# EasyEDA Pro project ProPrj_CraftVia-Core-S-RP235xA-v1-Rev0_2026-11-04.epro, schematic RPI-RP2350A-MINIMAL_R4-S1
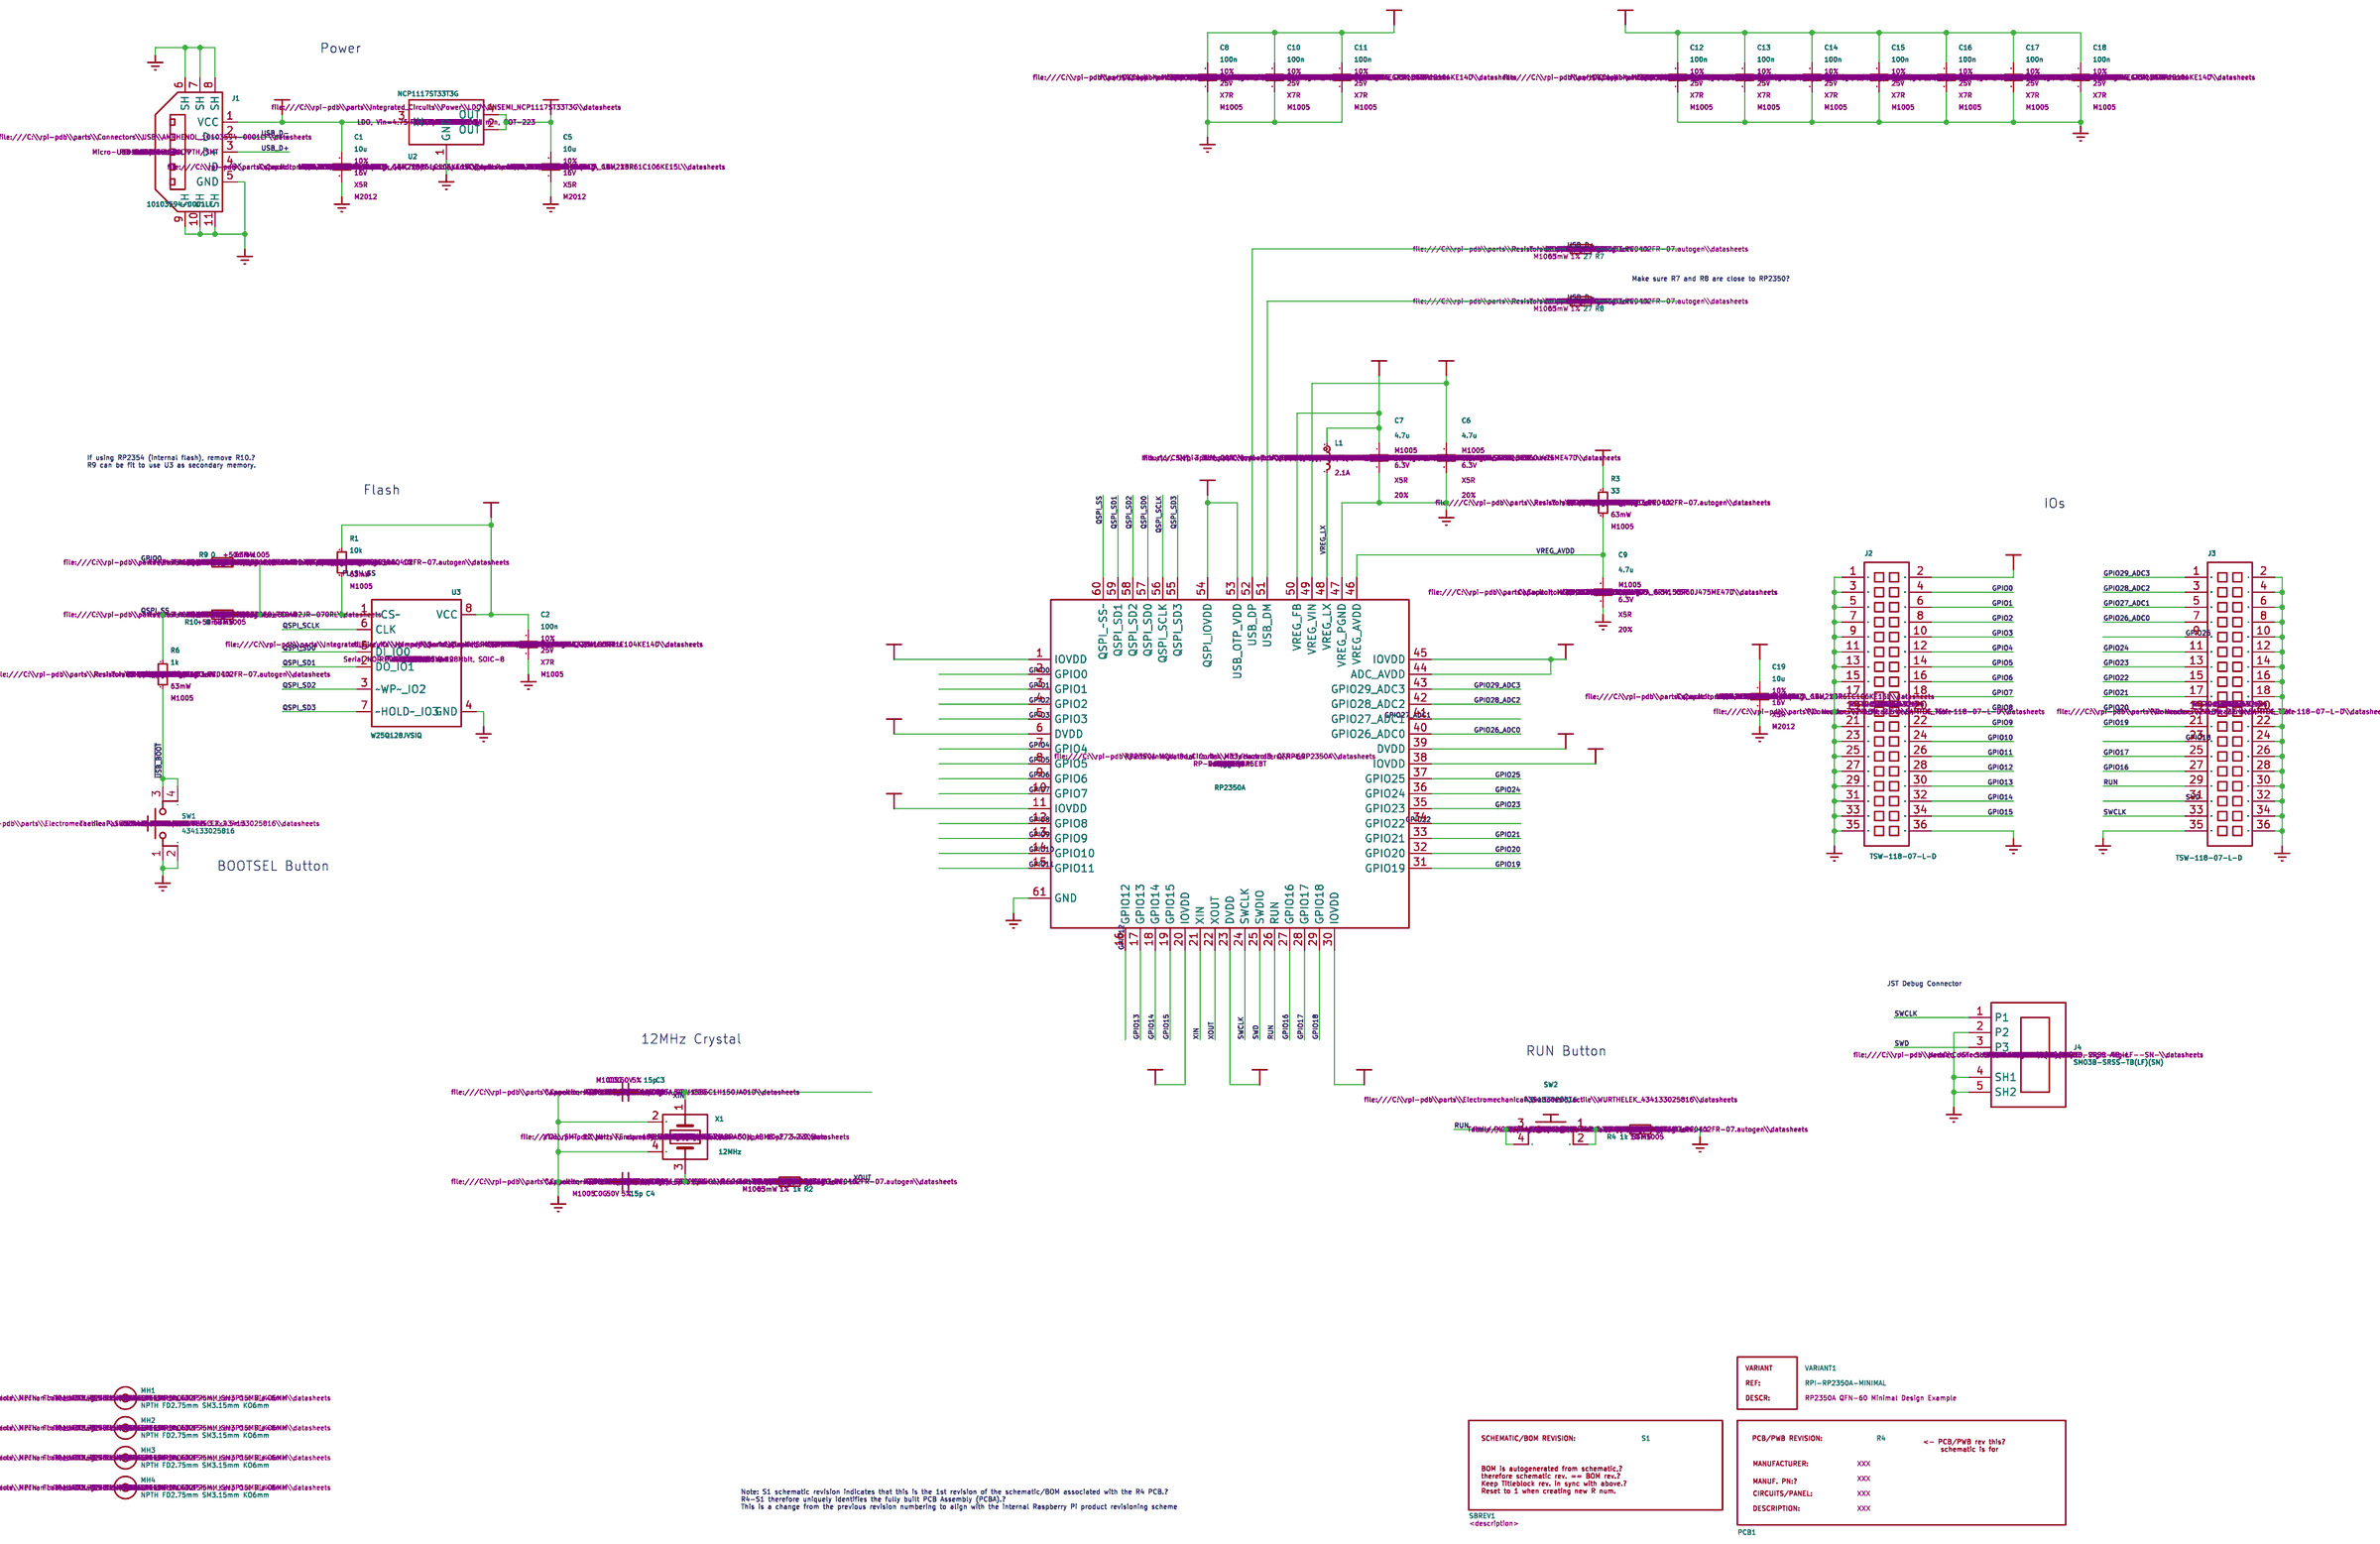
[diagram p0: schematic sheet]

## Parts
C1  10u  [RPI_COMPILED:generic_capc2012x125]
C2  100n  [RPI_COMPILED:generic_capc1005x50]
C3  15p  [RPI_COMPILED:generic_capc1005x50]
C4  15p  [RPI_COMPILED:generic_capc1005x50]
C5  10u  [RPI_COMPILED:generic_capc2012x125]
C6  4.7u  [RPI_COMPILED:generic_capc1005x50_wide]
C7  4.7u  [RPI_COMPILED:generic_capc1005x50_wide]
C8  100n  [RPI_COMPILED:generic_capc1005x50]
C9  4.7u  [RPI_COMPILED:generic_capc1005x50]
C10  100n  [RPI_COMPILED:generic_capc1005x50]
C11  100n  [RPI_COMPILED:generic_capc1005x50]
C12  100n  [RPI_COMPILED:generic_capc1005x50]
C13  100n  [RPI_COMPILED:generic_capc1005x50]
C14  100n  [RPI_COMPILED:generic_capc1005x50]
C15  100n  [RPI_COMPILED:generic_capc1005x50]
C16  100n  [RPI_COMPILED:generic_capc1005x50]
C17  100n  [RPI_COMPILED:generic_capc1005x50]
C18  100n  [RPI_COMPILED:generic_capc1005x50]
C19  10u  [RPI_COMPILED:generic_capc2012x125]
J1  10103594-0001LF  [RPI_COMPILED:amphenol_10103594-0001lf]
J2  TSW-118-07-L-D  [RPI_COMPILED:samtec_tsw-118-07-l-d]
J3  TSW-118-07-L-D  [RPI_COMPILED:samtec_tsw-118-07-l-d]
J4  SM03B-SRSS-TB(LF)(SN)  [RPI_COMPILED:jst_sm03b-srss-tb-lf--sn-]
L1  3.3u  [RPI_COMPILED:abracon_aota-b201610s3r3-101-t]
MH1  NPTH FD2.75mm SM3.15mm KO6mm  [RPI_COMPILED:none_mh_npth_fd2p75mm_sm3p15mm_ko6mm]
MH2  NPTH FD2.75mm SM3.15mm KO6mm  [RPI_COMPILED:none_mh_npth_fd2p75mm_sm3p15mm_ko6mm]
MH3  NPTH FD2.75mm SM3.15mm KO6mm  [RPI_COMPILED:none_mh_npth_fd2p75mm_sm3p15mm_ko6mm]
MH4  NPTH FD2.75mm SM3.15mm KO6mm  [RPI_COMPILED:none_mh_npth_fd2p75mm_sm3p15mm_ko6mm]
PCB1  R4
R1  10k  [RPI_COMPILED:generic_resc1005x35]
R2  1k  [RPI_COMPILED:generic_resc1005x35]
R3  33  [RPI_COMPILED:generic_resc1005x35]
R4  1k  [RPI_COMPILED:generic_resc1005x35]
R6  1k  [RPI_COMPILED:generic_resc1005x35]
R7  27  [RPI_COMPILED:generic_resc1005x35]
R8  27  [RPI_COMPILED:generic_resc1005x35]
R9  0  [RPI_COMPILED:generic_resc1005x35]
R10  0  [RPI_COMPILED:generic_resc1005x35]
SBREV1  S1
SW1  434133025816  [RPI_COMPILED:wurthelek_434133025816]
SW2  434133025816  [RPI_COMPILED:wurthelek_434133025816]
U1  RP2350A  [RPI_COMPILED:rpi_rp2350a_vias]
U2  NCP1117ST33T3G  [RPI_COMPILED:onsemi_ncp1117st33t3g]
U3  W25Q128JVSIQ  [RPI_COMPILED:generic_soic127p790x195-8]
VARIANT1  RPI-RP2350A-MINIMAL
X1  12MHz  [RPI_COMPILED:generic_xtalcc320x250x80-4]

## Library data of the parts
C1 C5 C19 = RPI_DB_Capacitors | MLCC | M2012/RP-01GYSK-AVBE41: Capacitor, MLCC, 10uF, 10%, M2012, 16V, X5R; UserDocLink: file:///C:\\rpi-pdb\\parts\\Capacitors\\MLCC\\M2012\\MURATA_GRM21BR61C106KE15L\\datasheets; package: M2012; voltage: 16V; dielectric: X5R; tolerance: 10%; part_uid: RP-01GYSK-AVBE41; manufacturer: Murata; manufacturer_pn: GRM21BR61C106KE15L; packaging: 180mm embossed taping; packaging_qty: 3000; temp_coefficient: X5R; operating_temp_max: +85C; operating_temp_min: -55C; material: Ceramic; size: 2.0x1.25x1.25mm; z_height_nom: 1.25mm; Datasheet: file:///C:\\rpi-pdb\\parts\\Capacitors\\MLCC\\M2012\\MURATA_GRM21BR61C106KE15L\\datasheets; status: OK; lcsc_pn: C77075
C2 C8 C10-C18 = RPI_DB_Capacitors | MLCC | M1005/RP-01BJ9Y-KRGF41: Capacitor, MLCC, 100nF, 10%, M1005, 25V, X7R; UserDocLink: file:///C:\\rpi-pdb\\parts\\Capacitors\\MLCC\\M1005\\MURATA_GRM155R71E104KE14D\\datasheets; package: M1005; voltage: 25V; dielectric: X7R; tolerance: 10%; part_uid: RP-01BJ9Y-KRGF41; manufacturer: Murata; manufacturer_pn: GRM155R71E104KE14D; packaging: 180mm paper taping; packaging_qty: 10000; temp_coefficient: X7R; operating_temp_max: +125C; operating_temp_min: -55C; material: Ceramic; size: 1.0x0.5x0.5mm; z_height_nom: 0.5mm; Datasheet: file:///C:\\rpi-pdb\\parts\\Capacitors\\MLCC\\M1005\\MURATA_GRM155R71E104KE14D\\datasheets; status: OK; lcsc_pn: C77014
C3 C4 = RPI_DB_Capacitors | MLCC | M1005/RP-01C89W-LLY9XV: Capacitor, MLCC, 15pF, 5%, M1005, 50V, C0G; UserDocLink: file:///C:\\rpi-pdb\\parts\\Capacitors\\MLCC\\M1005\\MURATA_GRM1555C1H150JA01D\\datasheets; package: M1005; voltage: 50V; dielectric: C0G; tolerance: 5%; part_uid: RP-01C89W-LLY9XV; manufacturer: Murata; manufacturer_pn: GRM1555C1H150JA01D; packaging: 180mm paper taping; packaging_qty: 10000; temp_coefficient: C0G; operating_temp_max: +125C; operating_temp_min: -55C; material: Ceramic; size: 1.0x0.5x0.5mm; z_height_nom: 0.5mm; Datasheet: file:///C:\\rpi-pdb\\parts\\Capacitors\\MLCC\\M1005\\MURATA_GRM1555C1H150JA01D\\datasheets; status: OK; lcsc_pn: C76950
C6 C7 C9 = RPI_DB_Capacitors | MLCC | M1005/RP-019A1P-0C2GHY: Capacitor, MLCC, 4.7uF, 20%, M1005, 6.3V, X5R; UserDocLink: file:///C:\\rpi-pdb\\parts\\Capacitors\\MLCC\\M1005\\MURATA_GRM155R60J475ME47D\\datasheets; package: M1005; voltage: 6.3V; dielectric: X5R; tolerance: 20%; part_uid: RP-019A1P-0C2GHY; manufacturer: Murata; manufacturer_pn: GRM155R60J475ME47D; packaging: 180mm paper taping; packaging_qty: 10000; temp_coefficient: X5R; operating_temp_max: +85C; operating_temp_min: -55C; material: Ceramic; size: 1.0x0.5x0.5mm; z_height_nom: 0.5mm; Datasheet: file:///C:\\rpi-pdb\\parts\\Capacitors\\MLCC\\M1005\\MURATA_GRM155R60J475ME47D\\datasheets; status: OK; lcsc_pn: C82453
J1 = RPI_DB_Connectors | USB/RP-019A1P-1JAX7V: Micro-USB B, Socket, RA, PTH/SMT; UserDocLink: file:///C:\\rpi-pdb\\parts\\Connectors\\USB\\AMPHENOL_10103594-0001LF\\datasheets; part_uid: RP-019A1P-1JAX7V; manufacturer: Amphenol; size: 8x6x2.85mm; z_height_nom: 2.85mm; Datasheet: file:///C:\\rpi-pdb\\parts\\Connectors\\USB\\AMPHENOL_10103594-0001LF\\datasheets; status: OK; lcsc_pn: C428495
J2 J3 = RPI_DB_Connectors | Pin_Headers/RP-01JWH2-G371Y4: Pin Header, 02x18W, 2.54mm, PTH, Male; UserDocLink: file:///C:\\rpi-pdb\\parts\\Connectors\\Pin_Headers\\SAMTEC_TSW-118-07-L-D\\datasheets; part_uid: RP-01JWH2-G371Y4; manufacturer: Samtec; size: 45.72x5.08x10.92mm; z_height_nom: 10.92mm; Datasheet: file:///C:\\rpi-pdb\\parts\\Connectors\\Pin_Headers\\SAMTEC_TSW-118-07-L-D\\datasheets; status: OK; lcsc_pn: C6887963
J4 = RPI_DB_Connectors | Rectangular/RP-01EKJ1-8V9SV1: Header, JST-SH, 01x03W, Pitch=1mm, SMD, Right Angle; UserDocLink: file:///C:\\rpi-pdb\\parts\\Connectors\\Rectangular\\JST_SM03B-SRSS-TB-LF--SN-\\datasheets; part_uid: RP-01EKJ1-8V9SV1; manufacturer: JST; packaging: 380mm dia. tape & reel; packaging_qty: 3000; size: 5x4.95x2.95mm; z_height_max: 3.25mm; z_height_nom: 2.95mm; Datasheet: file:///C:\\rpi-pdb\\parts\\Connectors\\Rectangular\\JST_SM03B-SRSS-TB-LF--SN-\\datasheets; status: OK
L1 = RPI_DB_Inductors | Fixed | M2016/RP-01GY5D-2VC7WP: Inductor, SMT, 3.3uH, 20%, Irms=2.1A, Isat=2.4A, DCR=115mR typ 140mR max, Polarity Marked, M2016; UserDocLink: file:///C:\\rpi-pdb\\parts\\Inductors\\Fixed\\M2016\\ABRACON_AOTA-B201610S3R3-101-T\\datasheets; rms_current: 2.1A; part_uid: RP-01GY5D-2VC7WP; manufacturer: Abracon; manufacturer_pn: AOTA-B201610S3R3-101-T; packaging: 180mm dia. tape & reel; packaging_qty: 3000; size: 2x1.6x1mm; tolerance: 20%; operating_temp_max: +125C; operating_temp_min: -40C; saturation_current: 2.4A; package: M2016; z_height_nom: 1mm; dcr: 115mR typ 140mR max; Datasheet: file:///C:\\rpi-pdb\\parts\\Inductors\\Fixed\\M2016\\ABRACON_AOTA-B201610S3R3-101-T\\datasheets; status: OK; lcsc_pn: C42411119
MH1-MH4 = RPI_DB_Mechanical | Mounting_Holes/RP-01HF5R-LCTEJS: Mounting Hole, NPTH, Finished Dia=2.75mm, Soldermask Dia=3.15mm, Keep Out Dia=6mm; UserDocLink: file:///C:\\rpi-pdb\\parts\\Mechanical\\Mounting_Holes\\NONE_MH_NPTH_FD2P75MM_SM3P15MM_KO6MM\\datasheets; part_uid: RP-01HF5R-LCTEJS; manufacturer: None; manufacturer_pn: MH_NPTH_FD2P75MM_SM3P15MM_KO6MM; size: FD2.75mm SM3.15mm KO6mm; Datasheet: file:///C:\\rpi-pdb\\parts\\Mechanical\\Mounting_Holes\\NONE_MH_NPTH_FD2P75MM_SM3P15MM_KO6MM\\datasheets; status: OK
PCB1 = RPI - BOM Directives_PCB_PWB_REV: XXX; manufacturer: XXX; manufacturer_pn: XXX; xdata1: XXX
R1 = RPI_DB_Resistors | Chip | M1005/RP-019A1P-53DHSX: Resistor, Chip, 10kR, M1005, 63mW, 1%; UserDocLink: file:///C:\\rpi-pdb\\parts\\Resistors\\Chip\\M1005\\YAGEO_RC0402FR-07.autogen\\datasheets; power: 63mW; tolerance: 1%; package: M1005; part_uid: RP-019A1P-53DHSX; manufacturer: Yageo; manufacturer_pn: RC0402FR-0710KL; packaging: 7 inch dia. paper taping reel; packaging_qty: 10000; temp_coefficient: 100ppm/degC; voltage: 50V; size: 1x0.5x0.35mm; z_height_max: 0.4mm; operating_temp_min: -55C; operating_temp_max: +155C; material: Thick Film; z_height_nom: 0.35mm; Datasheet: file:///C:\\rpi-pdb\\parts\\Resistors\\Chip\\M1005\\YAGEO_RC0402FR-07.autogen\\datasheets; status: OK; lcsc_pn: C60490
R2 R4 R6 = RPI_DB_Resistors | Chip | M1005/RP-019A1P-4Z6ZWY: Resistor, Chip, 1kR, M1005, 63mW, 1%; UserDocLink: file:///C:\\rpi-pdb\\parts\\Resistors\\Chip\\M1005\\YAGEO_RC0402FR-07.autogen\\datasheets; power: 63mW; tolerance: 1%; package: M1005; part_uid: RP-019A1P-4Z6ZWY; manufacturer: Yageo; manufacturer_pn: RC0402FR-071KL; packaging: 7 inch dia. paper taping reel; packaging_qty: 10000; temp_coefficient: 100ppm/degC; voltage: 50V; size: 1x0.5x0.35mm; z_height_max: 0.4mm; operating_temp_min: -55C; operating_temp_max: +155C; material: Thick Film; z_height_nom: 0.35mm; Datasheet: file:///C:\\rpi-pdb\\parts\\Resistors\\Chip\\M1005\\YAGEO_RC0402FR-07.autogen\\datasheets; status: OK; lcsc_pn: C106235
R3 = RPI_DB_Resistors | Chip | M1005/RP-019A1P-58PW9L: Resistor, Chip, 33R, M1005, 63mW, 1%; UserDocLink: file:///C:\\rpi-pdb\\parts\\Resistors\\Chip\\M1005\\YAGEO_RC0402FR-07.autogen\\datasheets; power: 63mW; tolerance: 1%; package: M1005; part_uid: RP-019A1P-58PW9L; manufacturer: Yageo; manufacturer_pn: RC0402FR-0733RL; packaging: 7 inch dia. paper taping reel; packaging_qty: 10000; temp_coefficient: 100ppm/degC; voltage: 50V; size: 1x0.5x0.35mm; z_height_max: 0.4mm; operating_temp_min: -55C; operating_temp_max: +155C; material: Thick Film; z_height_nom: 0.35mm; Datasheet: file:///C:\\rpi-pdb\\parts\\Resistors\\Chip\\M1005\\YAGEO_RC0402FR-07.autogen\\datasheets; status: OK; lcsc_pn: C138002
R7 R8 = RPI_DB_Resistors | Chip | M1005/RP-01C89V-LTEYC4: Resistor, Chip, 27R, M1005, 63mW, 1%; UserDocLink: file:///C:\\rpi-pdb\\parts\\Resistors\\Chip\\M1005\\YAGEO_RC0402FR-07.autogen\\datasheets; power: 63mW; tolerance: 1%; package: M1005; part_uid: RP-01C89V-LTEYC4; manufacturer: Yageo; manufacturer_pn: RC0402FR-0727RL; packaging: 7 inch dia. paper taping reel; packaging_qty: 10000; temp_coefficient: 100ppm/degC; voltage: 50V; size: 1x0.5x0.35mm; z_height_max: 0.4mm; operating_temp_min: -55C; operating_temp_max: +155C; material: Thick Film; z_height_nom: 0.35mm; Datasheet: file:///C:\\rpi-pdb\\parts\\Resistors\\Chip\\M1005\\YAGEO_RC0402FR-07.autogen\\datasheets; status: OK; lcsc_pn: C138021
R9 R10 = RPI_DB_Resistors | Chip | M1005/RP-019A1P-4Y4V63: Resistor, Chip, 0R, M1005, 63mW, +50mR; UserDocLink: file:///C:\\rpi-pdb\\parts\\Resistors\\Chip\\M1005\\YAGEO_RC0402JR-070RL\\datasheets; power: 63mW; tolerance: +50mR; package: M1005; part_uid: RP-019A1P-4Y4V63; manufacturer: Yageo; manufacturer_pn: RC0402JR-070RL; packaging: 7 inch dia. paper taping reel; packaging_qty: 10000; voltage: 50V; size: 1x0.5x0.35mm; z_height_max: 0.4mm; operating_temp_min: -55C; operating_temp_max: +150C; material: Thick Film; current: 1A Working, 2A Max; z_height_nom: 0.35mm; Datasheet: file:///C:\\rpi-pdb\\parts\\Resistors\\Chip\\M1005\\YAGEO_RC0402JR-070RL\\datasheets; status: OK; lcsc_pn: C60485
SBREV1 = RPI - BOM Directives_SCH_BOM_REV: <description>
SW1 SW2 = RPI_DB_Electromechanical | Switches | Tactile/RP-01H0MT-6E9H8F: Tactile Pushbutton, SPST, N.O., 4.2x3.2x2.5mm; UserDocLink: file:///C:\\rpi-pdb\\parts\\Electromechanical\\Switches\\Tactile\\WURTHELEK_434133025816\\datasheets; part_uid: RP-01H0MT-6E9H8F; manufacturer: Wurth Elektronik; packaging: 330mm dia. tape & reel; packaging_qty: 2900; size: 4.2x3.2x2.5mm; z_height_nom: 2.5mm; package: 4.2x3.2x2.5mm; Datasheet: file:///C:\\rpi-pdb\\parts\\Electromechanical\\Switches\\Tactile\\WURTHELEK_434133025816\\datasheets; status: DNU; lcsc_pn: C5504987
U1 = RPI_DB_Integrated_Circuits | Microcontrollers/RP-01HA9H-9K5E8T: RP2350A MCU, Dual Cortex M33/Hazard3, QFN-60; UserDocLink: file:///C:\\rpi-pdb\\parts\\Integrated_Circuits\\Microcontrollers\\RPI_RP2350A\\datasheets; part_uid: RP-01HA9H-9K5E8T; manufacturer: Raspberry Pi; operating_temp_max: +85C; operating_temp_min: -40C; package: QFN-60; size: 7x7x0.85mm; z_height_nom: 0.85mm; Datasheet: file:///C:\\rpi-pdb\\parts\\Integrated_Circuits\\Microcontrollers\\RPI_RP2350A\\datasheets; status: OK; lcsc_pn: C42411118
U2 = RPI_DB_Integrated_Circuits | Power | LDO/RP-01JWD9-7JRX6J: LDO, Vin=4.75-20V, Vout=3.3V, 1A min, SOT-223; UserDocLink: file:///C:\\rpi-pdb\\parts\\Integrated_Circuits\\Power\\LDO\\ONSEMI_NCP1117ST33T3G\\datasheets; part_uid: RP-01JWD9-7JRX6J; manufacturer: ON Semiconductor; packaging: Tape & Reel; packaging_qty: 4000; voltage: 3.3V; operating_temp_max: +125C; operating_temp_min: +0C; z_height_max: 1.8mm; package: SOT-223; size: 6.5x7x1.8mm; current: 1A; z_height_nom: 1.8mm; Datasheet: file:///C:\\rpi-pdb\\parts\\Integrated_Circuits\\Power\\LDO\\ONSEMI_NCP1117ST33T3G\\datasheets; status: OK; lcsc_pn: C26537
U3 = RPI_DB_Integrated_Circuits | Memory | Serial_Flash | SPI/RP-01JWD4-F1H4N9: Serial NOR Flash, QSPI, 3V, 128Mbit, SOIC-8; UserDocLink: file:///C:\\rpi-pdb\\parts\\Integrated_Circuits\\Memory\\Serial_Flash\\SPI\\WINBOND_W25Q128JVSIQ\\datasheets; part_uid: RP-01JWD4-F1H4N9; manufacturer: Winbond; voltage: 2.7-3.6V; z_height_max: 2.16mm; operating_temp_min: -40C; operating_temp_max: +85C; package: SOIC-8; capacity: 128Mbit; size: 7.9x5.28x1.95mm; z_height_nom: 1.95mm; Datasheet: file:///C:\\rpi-pdb\\parts\\Integrated_Circuits\\Memory\\Serial_Flash\\SPI\\WINBOND_W25Q128JVSIQ\\datasheets; status: OK; lcsc_pn: C97521
VARIANT1 = RPI - BOM Directives_VARIANT: RP2350A QFN-60 Minimal Design Example
X1 = RPI_DB_Frequency_Timing | Crystals/RP-01G8X7-GS352B: XTAL, SMT, 12 MHz, Fundamental, Ftol=30ppm, Fstab=30ppm, 10pF, 3.2x2.5mm; UserDocLink: file:///C:\\rpi-pdb\\parts\\Frequency_Timing\\Crystals\\ABRACON_ABM8-272-T3\\datasheets; part_uid: RP-01G8X7-GS352B; manufacturer: Abracon; manufacturer_pn: ABM8-272-T3; packaging: 180mm dia. tape & reel; packaging_qty: 3000; size: 3.2x2.5x0.8mm; tolerance: 30ppm; operating_temp_max: +85C; load_capacitance: 10pF; operating_temp_min: -40C; esr: 50R Max; package: M3225; z_height_nom: 0.8mm; freq_stability: 30ppm; Datasheet: file:///C:\\rpi-pdb\\parts\\Frequency_Timing\\Crystals\\ABRACON_ABM8-272-T3\\datasheets; status: OK; lcsc_pn: C20625731

## Nets
FLASH_SS: R1.2 R9.2 R10.2 U3.1(~CS~)
GPIO0: J2.4(Pin) R9.1 U1.2(GPIO0)
GPIO1: J2.6(Pin) U1.3(GPIO1)
GPIO2: J2.8(Pin) U1.4(GPIO2)
GPIO3: J2.10(Pin) U1.5(GPIO3)
GPIO4: J2.12(Pin) U1.7(GPIO4)
GPIO5: J2.14(Pin) U1.8(GPIO5)
GPIO6: J2.16(Pin) U1.9(GPIO6)
GPIO7: J2.18(Pin) U1.10(GPIO7)
GPIO8: J2.20(Pin) U1.12(GPIO8)
GPIO9: J2.22(Pin) U1.13(GPIO9)
GPIO10: J2.24(Pin) U1.14(GPIO10)
GPIO11: J2.26(Pin) U1.15(GPIO11)
GPIO12: J2.28(Pin) U1.16(GPIO12)
GPIO13: J2.30(Pin) U1.17(GPIO13)
GPIO14: J2.32(Pin) U1.18(GPIO14)
GPIO15: J2.34(Pin) U1.19(GPIO15)
GPIO16: J3.27(Pin) U1.27(GPIO16)
GPIO17: J3.25(Pin) U1.28(GPIO17)
GPIO18: J3.23(Pin) U1.29(GPIO18)
GPIO19: J3.21(Pin) U1.31(GPIO19)
GPIO20: J3.19(Pin) U1.32(GPIO20)
GPIO21: J3.17(Pin) U1.33(GPIO21)
GPIO22: J3.15(Pin) U1.34(GPIO22)
GPIO23: J3.13(Pin) U1.35(GPIO23)
GPIO24: J3.11(Pin) U1.36(GPIO24)
GPIO25: J3.9(Pin) U1.37(GPIO25)
GPIO26_ADC0: J3.7(Pin) U1.40(GPIO26_ADC0)
GPIO27_ADC1: J3.5(Pin) U1.41(GPIO27_ADC1)
GPIO28_ADC2: J3.3(Pin) U1.42(GPIO28_ADC2)
GPIO29_ADC3: J3.1(Pin) U1.43(GPIO29_ADC3)
QSPI_SCLK: U1.56(QSPI_SCLK) U3.6(CLK)
QSPI_SD0: U1.57(QSPI_SD0) U3.5(DI_IO0)
QSPI_SD1: U1.59(QSPI_SD1) U3.2(DO_IO1)
QSPI_SD2: U1.58(QSPI_SD2) U3.3(~WP~_IO2)
QSPI_SD3: U1.55(QSPI_SD3) U3.7(~HOLD~_IO3)
QSPI_SS: R6.1 R10.1 U1.60(QSPI_~SS~)
RPI - Power_GND: C1.2 C2.2 C3.2 C4.2 C5.2 C6.2 C7.2 C8.2 C9.2 C10.2 C11.2 C12.2 C13.2 C14.2 C15.2 C16.2 C17.2 C18.2 C19.2 J1.5(GND) J1.6(SH) J1.7(SH) J1.8(SH) J1.9(SH) J1.10(SH) J1.11(SH) J2.1(Pin) J2.3(Pin) J2.5(Pin) J2.7(Pin) J2.9(Pin) J2.11(Pin) J2.13(Pin) J2.15(Pin) J2.17(Pin) J2.19(Pin) J2.21(Pin) J2.23(Pin) J2.25(Pin) J2.27(Pin) J2.29(Pin) J2.31(Pin) J2.33(Pin) J2.35(Pin) J2.36(Pin) J3.2(Pin) J3.4(Pin) J3.6(Pin) J3.8(Pin) J3.10(Pin) J3.12(Pin) J3.14(Pin) J3.16(Pin) J3.18(Pin) J3.20(Pin) J3.22(Pin) J3.24(Pin) J3.26(Pin) J3.28(Pin) J3.30(Pin) J3.32(Pin) J3.34(Pin) J3.35(Pin) J3.36(Pin) J4.2(P2) J4.4(SH1) J4.5(SH2) R4.2 SW1.1 SW1.2 U1.47(VREG_PGND) U1.61(GND) U2.1(GND) U3.4(GND) X1.2 X1.4
RPI - Power_PWR_NET: C1.1 C2.1 C5.1 C6.1 C7.1 C8.1 C10.1 C11.1 C12.1 C13.1 C14.1 C15.1 C16.1 C17.1 C18.1 C19.1 J1.1(VCC) J2.2(Pin) L1.1 R1.1 R3.1 U1.1(IOVDD) U1.6(DVDD) U1.11(IOVDD) U1.20(IOVDD) U1.23(DVDD) U1.30(IOVDD) U1.38(IOVDD) U1.39(DVDD) U1.44(ADC_AVDD) U1.45(IOVDD) U1.49(VREG_VIN) U1.50(VREG_FB) U1.53(USB_OTP_VDD) U1.54(QSPI_IOVDD) U2.2(OUT) U2.3(IN) U2.4(OUT) U3.8(VCC)
RUN: J3.29(Pin) SW2.3 SW2.4 U1.26(RUN)
SWCLK: J3.33(Pin) J4.1(P1) U1.24(SWCLK)
SWD: J3.31(Pin) J4.3(P3) U1.25(SWDIO)
USB_D+: J1.3(D+) R7.1
USB_D-: J1.2(D-) R8.1
VREG_AVDD: C9.1 R3.2 U1.46(VREG_AVDD)
VREG_LX: L1.2 U1.48(VREG_LX)
XIN: C3.1 U1.21(XIN) X1.1
XOUT: R2.1 U1.22(XOUT)
~{USB_BOOT}: R6.2 SW1.3 SW1.4
Net-(C4-1): C4.1 R2.2 X1.3
Net-(R4-1): R4.1 SW2.1 SW2.2
Net-(R7-2): R7.2 U1.52(USB_DP)
Net-(R8-2): R8.2 U1.51(USB_DM)

Not connected (* = marked no-connect by the designer): J1 4(ID)*

## Notes on the sheet
- Power
- Make sure R7 and R8 are close to RP2350
- If using RP2354 (internal flash), remove R10.
  R9 can be fit to use U3 as secondary memory.
- Flash
- IOs
- BOOTSEL Button
- JST Debug Connector
- 12MHz Crystal
- RUN Button
- Note: S1 schematic revision indicates that this is the 1st revision of the schematic/BOM associated with the R4 PCB.
  R4-S1 therefore uniquely identifies the fully built PCB Assembly (PCBA).
  This is a change from the previous revision numbering to align with the internal Raspberry Pi product revisioning scheme
